# Altium project Main_Board.PrjPcb (part 8 of 44)

## Sheet LTC6952.SchDoc
size A3
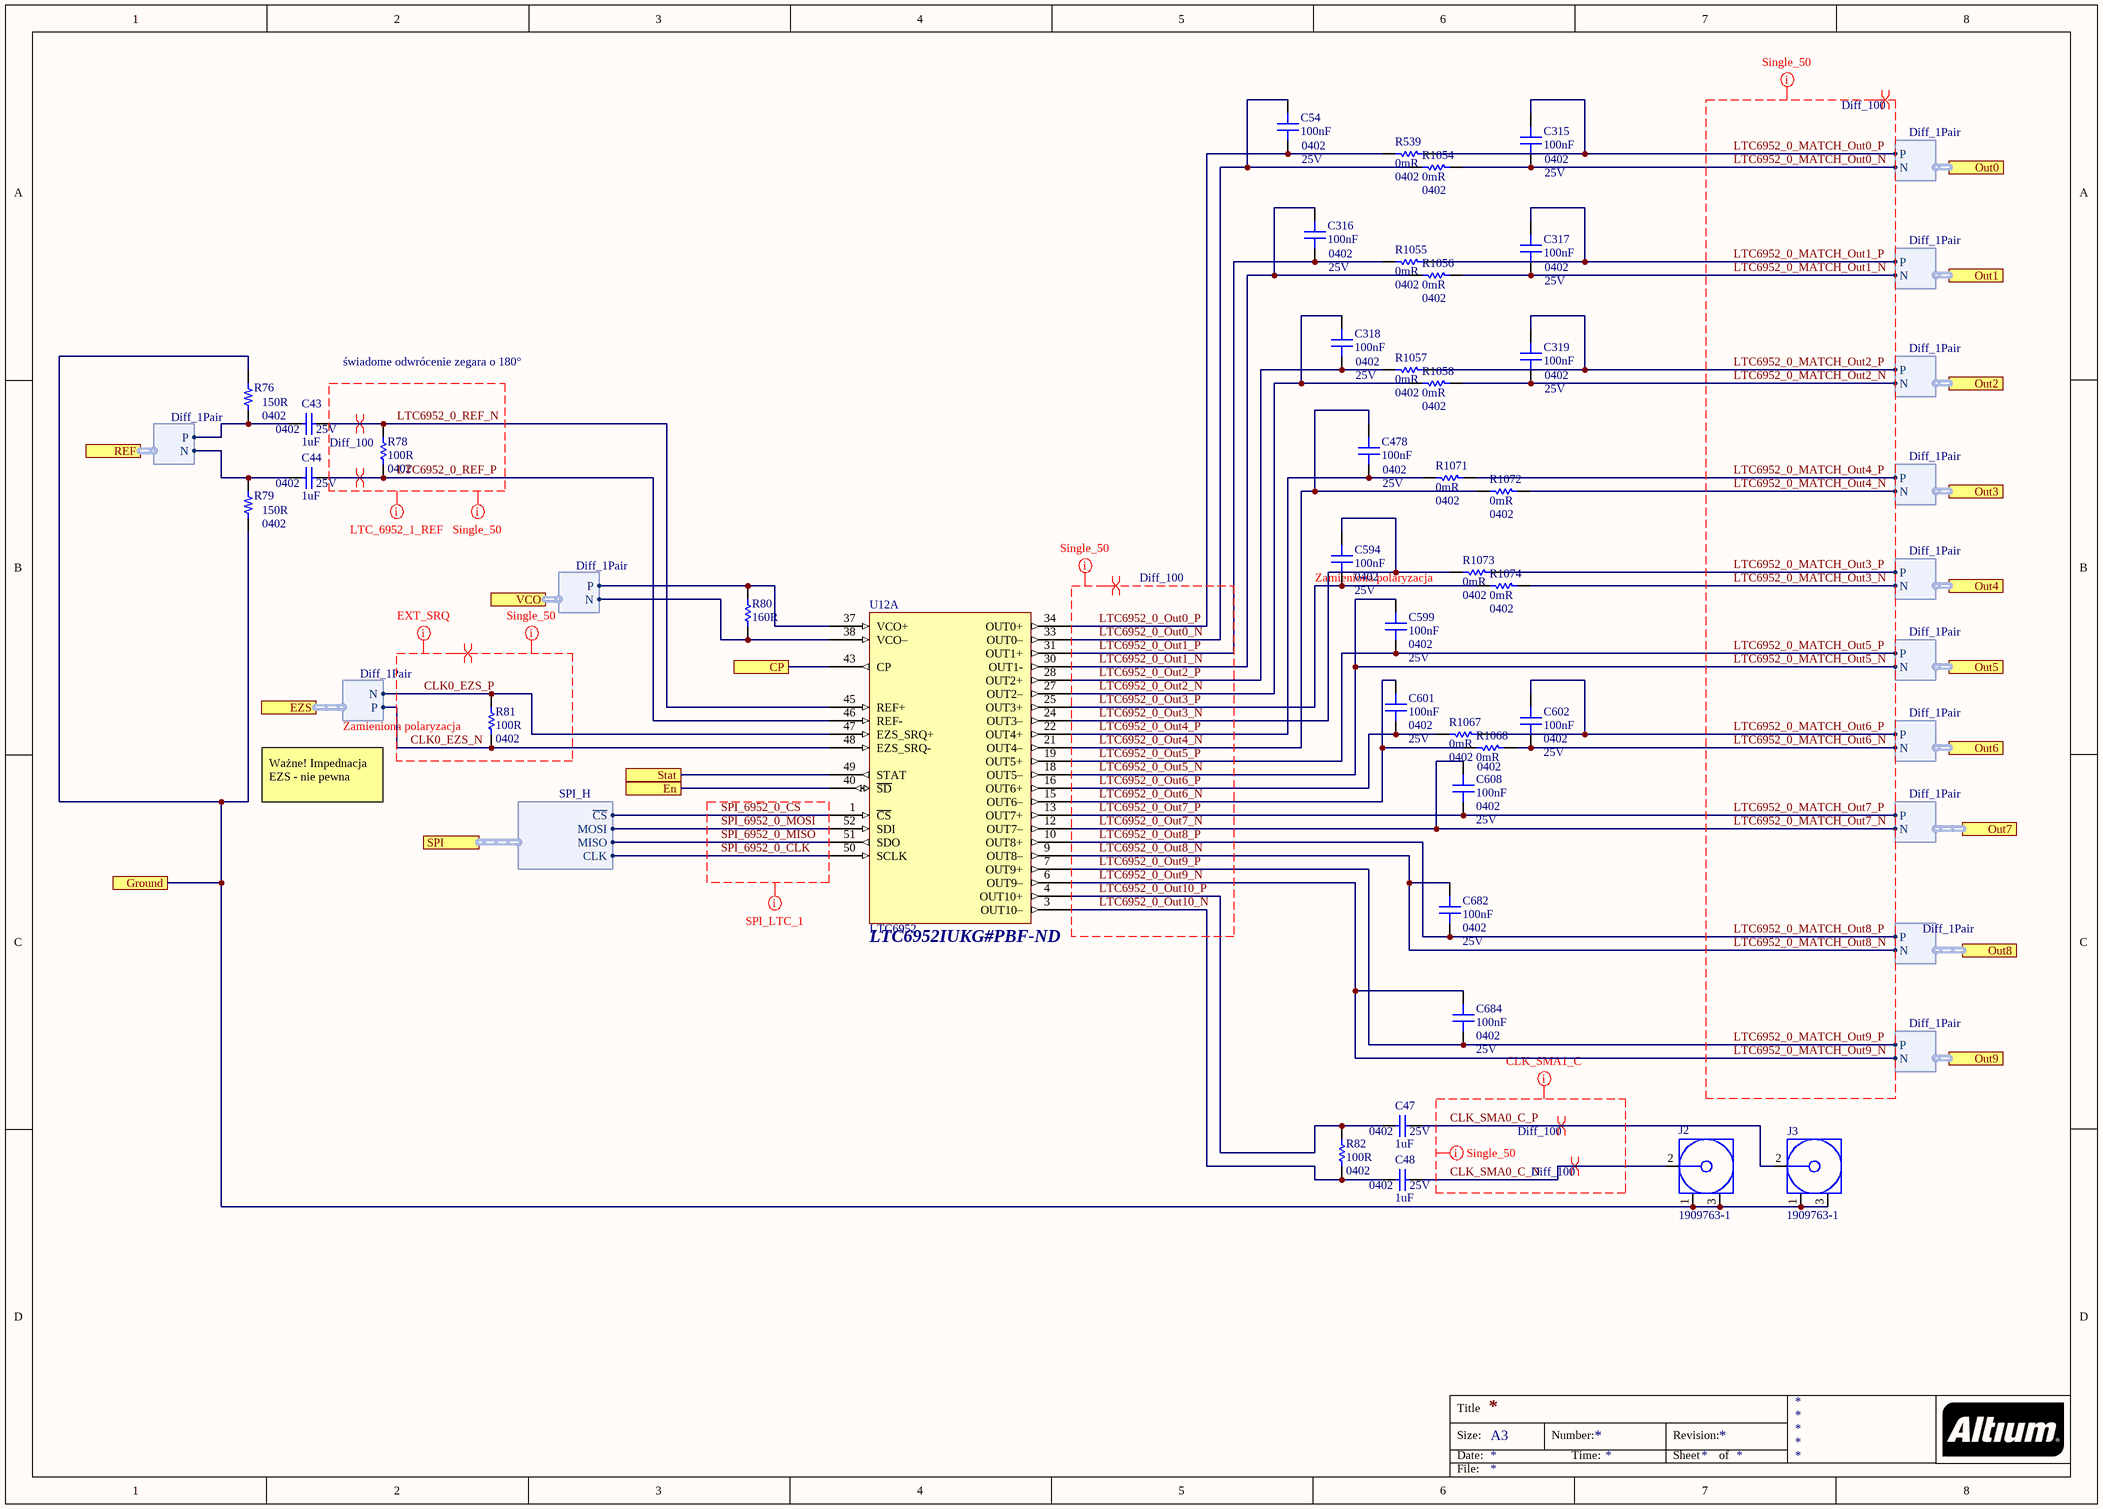
[diagram p9: LTC6952.SchDoc]

### Parts
(Parts that share a designator on the sheet are numbered #1, #2 ... from top to bottom, then left to right.)
C43  1uF  Case/Package: 0402  Voltage Rating: 25V  [CAP 0402/1005 KK]
C44  1uF  Case/Package: 0402  Voltage Rating: 25V  [CAP 0402/1005 KK]
C47  1uF  Case/Package: 0402  Voltage Rating: 25V  [CAP 0402/1005 KK]
C48  1uF  Case/Package: 0402  Voltage Rating: 25V  [CAP 0402/1005 KK]
C54  100nF  Case/Package: 0402  Voltage Rating: 25V  [CAP 0402/1005 KK]
C315  100nF  Case/Package: 0402  Voltage Rating: 25V  [CAP 0402/1005 KK]
C316  100nF  Case/Package: 0402  Voltage Rating: 25V  [CAP 0402/1005 KK]
C317  100nF  Case/Package: 0402  Voltage Rating: 25V  [CAP 0402/1005 KK]
C318  100nF  Case/Package: 0402  Voltage Rating: 25V  [CAP 0402/1005 KK]
C319  100nF  Case/Package: 0402  Voltage Rating: 25V  [CAP 0402/1005 KK]
C478#1  100nF  Case/Package: 0402  Voltage Rating: 25V  [CAP 0402/1005 KK]
C594  100nF  Case/Package: 0402  Voltage Rating: 25V  [CAP 0402/1005 KK]
C599  100nF  Case/Package: 0402  Voltage Rating: 25V  [CAP 0402/1005 KK]
C601  100nF  Case/Package: 0402  Voltage Rating: 25V  [CAP 0402/1005 KK]
C602  100nF  Case/Package: 0402  Voltage Rating: 25V  [CAP 0402/1005 KK]
C608  100nF  Case/Package: 0402  Voltage Rating: 25V  [CAP 0402/1005 KK]
C682  100nF  Case/Package: 0402  Voltage Rating: 25V  [CAP 0402/1005 KK]
C684  100nF  Case/Package: 0402  Voltage Rating: 25V  [CAP 0402/1005 KK]
J2  1909763-1  [TECO-1909763-1_V]
J3  1909763-1  [TECO-1909763-1_V]
R76  150R  Case/Package: 0402  [RES 0402/1005 RF KK]
R78  100R  Case/Package: 0402  [RES 0402/1005 RF KK]
R79  150R  Case/Package: 0402  [RES 0402/1005 RF KK]
R80  160R  [RES 0402/1005 RF KK]
R81  100R  Case/Package: 0402  [RES 0402/1005 RF KK]
R82  100R  Case/Package: 0402  [RES 0402/1005 RF KK]
R539  0mR  Case/Package: 0402  [RES 0402/1005 RF KK]
R1054  0mR  Case/Package: 0402  [RES 0402/1005 RF KK]
R1055  0mR  Case/Package: 0402  [RES 0402/1005 RF KK]
R1056  0mR  Case/Package: 0402  [RES 0402/1005 RF KK]
R1057  0mR  Case/Package: 0402  [RES 0402/1005 RF KK]
R1058  0mR  Case/Package: 0402  [RES 0402/1005 RF KK]
R1067  0mR  Case/Package: 0402  [RES 0402/1005 RF KK]
R1068  0mR  Case/Package: 0402  [RES 0402/1005 RF KK]
R1071  0mR  Case/Package: 0402  [RES 0402/1005 RF KK]
R1072  0mR  Case/Package: 0402  [RES 0402/1005 RF KK]
R1073  0mR  Case/Package: 0402  [RES 0402/1005 RF KK]
R1074  0mR  Case/Package: 0402  [RES 0402/1005 RF KK]
U12  LTC6952  Supplier Part Number 1: LTC6952IUKG#PBF-ND  [LTC6952]  (part A of 2)

### Ports
CP, En, EZS (harness Diff_1Pair), Ground, Out0 (harness Diff_1Pair), Out1 (harness Diff_1Pair), Out2 (harness Diff_1Pair), Out3 (harness Diff_1Pair), Out4 (harness Diff_1Pair), Out5 (harness Diff_1Pair), Out6 (harness Diff_1Pair), Out7 (harness Diff_1Pair), Out8 (harness Diff_1Pair), Out9 (harness Diff_1Pair), REF (harness Diff_1Pair), SPI (harness SPI_H), Stat, VCO (harness Diff_1Pair)

### Harnesses
SPI_H: CLK, MISO, MOSI, ~{CS}
Diff_1Pair: N, P

### Nets
AGND: J2.1 J2.3 J3.1 J3.3 R76.2 R79.1 ; port Ground
CLK0_EZS_N: R81.1 U12.48(EZS_SRQ-) ; port EZS.P
CLK0_EZS_P: R81.2 U12.47(EZS_SRQ+) ; port EZS.N
CLK_SMA0_C_N: C48.1 J2.2
CLK_SMA0_C_P: C47.1 J3.2
Enable_CLK: U12.40(~{SD}) ; port En
LTC6952_0_MATCH_Out0_N: C315.1 R1054.1 ; port Out0.N
LTC6952_0_MATCH_Out0_P: C315.2 R539.1 ; port Out0.P
LTC6952_0_MATCH_Out1_N: C317.1 R1056.1 ; port Out1.N
LTC6952_0_MATCH_Out1_P: C317.2 R1055.1 ; port Out1.P
LTC6952_0_MATCH_Out2_N: C319.1 R1058.1 ; port Out2.N
LTC6952_0_MATCH_Out2_P: C319.2 R1057.1 ; port Out2.P
LTC6952_0_MATCH_Out3_N: R1074.1 ; port Out4.N
LTC6952_0_MATCH_Out3_P: R1073.1 ; port Out4.P
LTC6952_0_MATCH_Out4_N: R1072.2 ; port Out3.N
LTC6952_0_MATCH_Out4_P: R1071.2 ; port Out3.P
LTC6952_0_MATCH_Out5_N: C599.1 U12.18(OUT5–) ; port Out5.N  [also labelled LTC6952_0_Out5_N]
LTC6952_0_MATCH_Out5_P: C599.2 U12.19(OUT5+) ; port Out5.P  [also labelled LTC6952_0_Out5_P]
LTC6952_0_MATCH_Out6_N: C602.2 R1068.1 ; port Out6.N
LTC6952_0_MATCH_Out6_P: C602.1 R1067.1 ; port Out6.P
LTC6952_0_MATCH_Out7_N: C608.1 U12.12(OUT7–) ; port Out7.N  [also labelled LTC6952_0_Out7_N]
LTC6952_0_MATCH_Out7_P: C608.2 U12.13(OUT7+) ; port Out7.P  [also labelled LTC6952_0_Out7_P]
LTC6952_0_MATCH_Out8_N: C682.1 U12.9(OUT8–) ; port Out8.N  [also labelled LTC6952_0_Out8_N]
LTC6952_0_MATCH_Out8_P: C682.2 U12.10(OUT8+) ; port Out8.P  [also labelled LTC6952_0_Out8_P]
LTC6952_0_MATCH_Out9_N: C684.1 U12.6(OUT9–) ; port Out9.N  [also labelled LTC6952_0_Out9_N]
LTC6952_0_MATCH_Out9_P: C684.2 U12.7(OUT9+) ; port Out9.P  [also labelled LTC6952_0_Out9_P]
LTC6952_0_Out0_N: C54.2 R1054.2 U12.33(OUT0–)
LTC6952_0_Out0_P: C54.1 R539.2 U12.34(OUT0+)
LTC6952_0_Out1_N: C316.2 R1056.2 U12.30(OUT1-)
LTC6952_0_Out1_P: C316.1 R1055.2 U12.31(OUT1+)
LTC6952_0_Out2_N: C318.2 R1058.2 U12.27(OUT2–)
LTC6952_0_Out2_P: C318.1 R1057.2 U12.28(OUT2+)
LTC6952_0_Out3_N: C594.1 R1073.2 U12.24(OUT3–)
LTC6952_0_Out3_P: C594.2 R1074.2 U12.25(OUT3+)
LTC6952_0_Out4_N: C478#1.2 R1072.1 U12.21(OUT4–)
LTC6952_0_Out4_P: C478#1.1 R1071.1 U12.22(OUT4+)
LTC6952_0_Out6_N: C601.1 R1068.2 U12.15(OUT6–)
LTC6952_0_Out6_P: C601.2 R1067.2 U12.16(OUT6+)
LTC6952_0_Out10_N: C48.2 R82.1 U12.3(OUT10–)
LTC6952_0_Out10_P: C47.2 R82.2 U12.4(OUT10+)
LTC6952_0_REF_N: C43.1 R78.2 U12.45(REF+)
LTC6952_0_REF_P: C44.1 R78.1 U12.46(REF-)
LTC6952_1_CP_Out: U12.43(CP) ; port CP
LTC6952_1_Temp: U12.49(STAT) ; port Stat
LTC6952_1_VCO_N: R80.2 U12.37(VCO+) ; port VCO.P
LTC6952_1_VCO_P: R80.1 U12.38(VCO–) ; port VCO.N
Si53323_2_Q1_N: C44.2 R79.2 ; port REF.N
Si53323_2_Q1_P: C43.2 R76.1 ; port REF.P
SPI_6952_0_CLK: U12.50(SCLK) ; port SPI.CLK  [project net CLK0_SPI.CLK]
SPI_6952_0_CS: U12.1(~{CS}) ; port SPI.~{CS}  [project net CLK0_SPI.~{CS}]
SPI_6952_0_MISO: U12.51(SDO) ; port SPI.MISO  [project net CLK0_SPI.MISO]
SPI_6952_0_MOSI: U12.52(SDI) ; port SPI.MOSI  [project net CLK0_SPI.MOSI]

### Layout directives
differential pair; differential pair class Diff_100: CLK0_EZS_N, CLK0_EZS_P, CLK_SMA0_C_N, CLK_SMA0_C_P, LTC6952_0_MATCH_Out0_N, LTC6952_0_MATCH_Out0_P, LTC6952_0_MATCH_Out1_N, LTC6952_0_MATCH_Out1_P, LTC6952_0_MATCH_Out2_N, LTC6952_0_MATCH_Out2_P, LTC6952_0_MATCH_Out3_N, LTC6952_0_MATCH_Out3_P, LTC6952_0_MATCH_Out4_N, LTC6952_0_MATCH_Out4_P, LTC6952_0_MATCH_Out5_N, LTC6952_0_MATCH_Out5_P, LTC6952_0_MATCH_Out6_N, LTC6952_0_MATCH_Out6_P, LTC6952_0_MATCH_Out7_N, LTC6952_0_MATCH_Out7_P, LTC6952_0_MATCH_Out8_N, LTC6952_0_MATCH_Out8_P, LTC6952_0_MATCH_Out9_N, LTC6952_0_MATCH_Out9_P, LTC6952_0_Out0_N, LTC6952_0_Out0_P, LTC6952_0_Out1_N, LTC6952_0_Out1_P, LTC6952_0_Out2_N, LTC6952_0_Out2_P, LTC6952_0_Out3_N, LTC6952_0_Out3_P, LTC6952_0_Out4_N, LTC6952_0_Out4_P, LTC6952_0_Out5_N, LTC6952_0_Out5_P, LTC6952_0_Out6_N, LTC6952_0_Out6_P, LTC6952_0_Out7_N, LTC6952_0_Out7_P, LTC6952_0_Out8_N, LTC6952_0_Out8_P, LTC6952_0_Out9_N, LTC6952_0_Out9_P, LTC6952_0_Out10_N, LTC6952_0_Out10_P, LTC6952_0_REF_N, LTC6952_0_REF_P
net class Single_50: CLK0_EZS_N, CLK0_EZS_P, CLK_SMA0_C_N, CLK_SMA0_C_P, LTC6952_0_MATCH_Out0_N, LTC6952_0_MATCH_Out0_P, LTC6952_0_MATCH_Out1_N, LTC6952_0_MATCH_Out1_P, LTC6952_0_MATCH_Out2_N, LTC6952_0_MATCH_Out2_P, LTC6952_0_MATCH_Out3_N, LTC6952_0_MATCH_Out3_P, LTC6952_0_MATCH_Out4_N, LTC6952_0_MATCH_Out4_P, LTC6952_0_MATCH_Out5_N, LTC6952_0_MATCH_Out5_P, LTC6952_0_MATCH_Out6_N, LTC6952_0_MATCH_Out6_P, LTC6952_0_MATCH_Out7_N, LTC6952_0_MATCH_Out7_P, LTC6952_0_MATCH_Out8_N, LTC6952_0_MATCH_Out8_P, LTC6952_0_MATCH_Out9_N, LTC6952_0_MATCH_Out9_P, LTC6952_0_Out0_N, LTC6952_0_Out0_P, LTC6952_0_Out1_N, LTC6952_0_Out1_P, LTC6952_0_Out2_N, LTC6952_0_Out2_P, LTC6952_0_Out3_N, LTC6952_0_Out3_P, LTC6952_0_Out4_N, LTC6952_0_Out4_P, LTC6952_0_Out5_N, LTC6952_0_Out5_P, LTC6952_0_Out6_N, LTC6952_0_Out6_P, LTC6952_0_Out7_N, LTC6952_0_Out7_P, LTC6952_0_Out8_N, LTC6952_0_Out8_P, LTC6952_0_Out9_N, LTC6952_0_Out9_P, LTC6952_0_Out10_N, LTC6952_0_Out10_P, LTC6952_0_REF_N, LTC6952_0_REF_P
net class CLK_SMA1_C: CLK_SMA0_C_N, CLK_SMA0_C_P
net class LTC_6952_1_REF: LTC6952_0_REF_N, LTC6952_0_REF_P
net class EXT_SRQ: CLK0_EZS_N, CLK0_EZS_P
net class SPI_LTC_1: SPI_6952_0_CLK, SPI_6952_0_CS, SPI_6952_0_MISO, SPI_6952_0_MOSI

### Notes on the sheet
- świadome odwrócenie zegara o 180°
- (near C594) Zamieniona polaryzacja
- (near R81) Zamieniona polaryzacja
- Ważne! Impednacja EZS - nie pewna
- Title
- Size:
- Date:
- A3
- Number:
- Time:
- Revision:
- Sheet
- of
- File:

### Library data of the parts
C43 C44 C47 C48 = Capacitor: MURATA - GRT155R61E105KE01D - SMD Multilayer Ceramic Capacitor, 1 µF, 25 V, 0402 [1005 Metric], ± 10%, X5R, GRT Series - SMD Multilayer Ceramic Capacitor, 1 µF, 25 V, 0402 [1005 Metric], ± 10%, X5R, GRT Series; Supplier 1: Digi-Key; Supplier Part Number 1: 490-12263-1-ND; Manufacturer: Murata; Manufacturer Part Number: GRT155R61E105KE01D; RoHS: Yes; Category: Ceramic Capacitors; Stock 1: 341453; Pricing 1: 1=0,18000, 10=0,12300, 100=0,06210, 500=0,04248, 1000=0,03758, 2500=0,03594, 5000=0,03268 (USD); Mount: Surface Mount; Case Code (Metric): 1005; Case Code (Imperial): 0402; Min Operating Temperature: -55°C; Max Operating Temperature: 85°C; Packaging: Tape and Reel; Capacitance: 1uF; Tolerance: 10%; Dielectric: X5R; Voltage Rating (DC): 25V; Length: 0.039inch; Width: 0.02inch; Thickness: 0.022inch; Ratings: AEC-Q200; ComponentLink1URL: http://www.farnell.com/datasheets/2165918.pdf?src-supplier=Farnell; ComponentLink1Description: http://www.farnell.com/datasheets/2165918.pdf?src-supplier=Farnell; ComponentLink2URL: http://search.murata.co.jp/Ceramy/image/img/A01X/G101/ENG/GRT155R61E105KE01-01.pdf?src-supplier=Digi-Key; ComponentLink2Description: http://search.murata.co.jp/Ceramy/image/img/A01X/G101/ENG/GRT155R61E105KE01-01.pdf?src-supplier=Digi-Key; ComponentLink3URL: http://www.farnell.com/datasheets/2165918.pdf?src-supplier=Element14; ComponentLink3Description: http://www.farnell.com/datasheets/2165918.pdf?src-supplier=Element14
C54 C315-C319 C478#1 C594 C599 C601 C602 C608 C682 C684 = Capacitor: Manufacturer: Murata; Manufacturer Part Number: GRM155R71E104KE14J; Tolerance: 10%; Dielectric: X7R; Supplier 1: Digi-Key; Supplier Part Number 1: 490-14603-1-ND; Stock 1: 89275; Pricing 1: 1 = 0,10000, 10 = 0,03400, 100 = 0,01520, 500 = 0,01088, 1000 = 0,00855, 2500 = 0,00778, 5000 = 0,00715 (USD); RoHS: Yes; Mount: Surface Mount; Weight: 0.000212oz; Case Code (Imperial): 0402; Case Code (Metric): 1005; Min Operating Temperature: -55°C; Max Operating Temperature: 125°C; Packaging: Tape and Reel; Capacitance: 100nF; Termination: SMD/SMT; Composition: Ceramic; Voltage Rating (DC): 25V; Package Quantity: 50000; Length: 0.039inch; Height: 0.5mm; Width: 0.5mm; Thickness: 0.022inch; ComponentLink1URL: http://www.mouser.com/ds/2/281/c02e-2905.pdf?src-supplier=Mouser; ComponentLink1Description: http://www.mouser.com/ds/2/281/c02e-2905.pdf?src-supplier=Mouser; ComponentLink2URL: http://search.murata.co.jp/Ceramy/image/img/A01X/G101/ENG/GRM155R71E104KE14-01.pdf?src-supplier=Digi-Key; ComponentLink2Description: http://search.murata.co.jp/Ceramy/image/img/A01X/G101/ENG/GRM155R71E104KE14-01.pdf?src-supplier=Digi-Key
J2 J3 = 1909763-1: Ultra Miniature Coaxial Connector Jack, 60 V, 50 Ohm, -40 to 90 degC, RoHS, Tape and Reel; Brand: TE Connectivity / AMP; Maximum Frequency: 6 GHz; Gender: Jack (Female); Body Material: Liquid Crystal Polymer (LCP); RF Series: UMCC; Impedance: 50 Ohms; DatasheetVersion: Rev. B2; PackageReference: SMD; PackageDescription: 3-Pin Surface Mount Device, Body 2.6 x 2.6 mm; Supplier 1: Newark; Supplier Part Number 1: 62X0488; Supplier 2: Farnell; Supplier Part Number 2: 2781689; Supplier 3: Digi-Key; Supplier Part Number 3: A118077TR-ND; Supplier 4: Digi-Key; Supplier Part Number 4: A118077CT-ND; Supplier 5: Digi-Key; Supplier Part Number 5: A118077DKR-ND; Product Category: RF Connectors / Coaxial Connectors; Packaging: Reel; Product: Connectors; Orientation: Straight; Operating Temperature Range: - 40 C to + 90 C; Factory Pack Quantity: 5000; RoHS: Details; Contact Plating: Gold; Contact Material: Copper Alloy; Mounting Technology: Surface Mount; ComponentLink1Description: Manufacturer URL; ComponentLink1URL: http://www.te.com; ComponentLink2Description: Datasheet; ComponentLink2URL: http://www.te.com/commerce/DocumentDelivery/DDEController?Action=srchrtrv&DocNm=1909763&DocType=Customer+Drawing&DocLang=English
R76 R79 = Resistor: RES SMD 150 OHM 1% 1/10W 0402; Manufacturer: Panasonic; Manufacturer Part Number: ERJ-2RKF1500X; Temperature Coefficient: 100ppm/°C; Power Rating: 100mW; Voltage Rating: 50V; Supplier 1: Digi-Key; Supplier Part Number 1: P150LCT-ND; RoHS: Yes; Category: Chip SMD Resistors; Stock 1: 1074892; Pricing 1: 1=0,10000, 10=0,04100, 100=0,01670, 1000=0,00751, 2500=0,00652, 5000=0,00538 (USD); Mount: Surface Mount; Number of Pins: 2; Contact Plating: Tin; Case Code (Metric): 1005; Case Code (Imperial): 0402; Min Operating Temperature: -55°C; Max Operating Temperature: 155°C; Resistance: 150R; Tolerance: 1%; Composition: Thick Film; Packaging: Tape and Reel; Package Quantity: 1; Number of Terminations: 2; Termination: SMD/SMT; Military Standard: Not; Max Power Dissipation: 100mW; Voltage Rating (DC): 50V; Features: Automotive AEC-Q200; Length: 1mm; Height: 0.35mm; Width: 0.02inch; Depth: 0.5mm; Radiation Hardening: No; REACH SVHC: No SVHC; Lead Free: Lead Free; ComponentLink1URL: https://datasheet.ciiva.com/34303/1987126-34303555.pdf?src-supplier=Jameco; ComponentLink1Description: https://datasheet.ciiva.com/34303/1987126-34303555.pdf?src-supplier=Jameco; ComponentLink2URL: https://datasheet.ciiva.com/11821/0900766b80f80784-11821183.pdf?src-supplier=RSComponents; ComponentLink2Description: https://datasheet.ciiva.com/11821/0900766b80f80784-11821183.pdf?src-supplier=RSComponents; ComponentLink3URL: https://datasheet.ciiva.com/16774/70260748-16774549.pdf?src-supplier=Allied+Electronics; ComponentLink3Description: https://datasheet.ciiva.com/16774/70260748-16774549.pdf?src-supplier=Allied+Electronics; ComponentLink4URL: https://datasheet.ciiva.com/43467/1678782-43467237.pdf?src-supplier=Farnell; ComponentLink4Description: https://datasheet.ciiva.com/43467/1678782-43467237.pdf?src-supplier=Farnell; ComponentLink5URL: https://datasheet.ciiva.com/7887/426256-7887016.pdf?src-supplier=Element14; ComponentLink5Description: https://datasheet.ciiva.com/7887/426256-7887016.pdf?src-supplier=Element14; ComponentLink6URL: https://datasheet.ciiva.com/16371/aoa0000ce2-16371497.pdf?src-supplier=Future+Electronics; ComponentLink6Description: https://datasheet.ciiva.com/16371/aoa0000ce2-16371497.pdf?src-supplier=Future+Electronics; ComponentLink7URL: https://datasheet.ciiva.com/7886/aoa0000ce2-7886714.pdf?src-supplier=Element14; ComponentLink7Description: https://datasheet.ciiva.com/7886/aoa0000ce2-7886714.pdf?src-supplier=Element14; ComponentLink8URL: https://datasheet.ciiva.com/46373/1678782-46373162.pdf?src-supplier=Element14; ComponentLink8Description: https://datasheet.ciiva.com/46373/1678782-46373162.pdf?src-supplier=Element14; ComponentLink9URL: https://datasheet.ciiva.com/46373/1678782-46373163.pdf?src-supplier=Element14; ComponentLink9Description: https://datasheet.ciiva.com/46373/1678782-46373163.pdf?src-supplier=Element14; ComponentLink10URL: https://datasheet.ciiva.com/16770/70260748-16770572.pdf?src-supplier=Allied+Electronics; ComponentLink10Description: https://datasheet.ciiva.com/16770/70260748-16770572.pdf?src-supplier=Allied+Electronics; ComponentLink11URL: https://datasheet.ciiva.com/17207/aoa0000ce2-17207389.pdf?src-supplier=Avnet+Europe; ComponentLink11Description: https://datasheet.ciiva.com/17207/aoa0000ce2-17207389.pdf?src-supplier=Avnet+Europe; ComponentLink12URL: https://datasheet.ciiva.com/28568/1678782-28568846.pdf?src-supplier=Element14; ComponentLink12Description: https://datasheet.ciiva.com/28568/1678782-28568846.pdf?src-supplier=Element14; ComponentLink13URL: https://datasheet.ciiva.com/30106/aoa0000ce2-30106926.pdf?src-supplier=Onlinecomponents.com; ComponentLink13Description: https://datasheet.ciiva.com/30106/aoa0000ce2-30106926.pdf?src-supplier=Onlinecomponents.com; ComponentLink14URL: https://datasheet.ciiva.com/22673/1678782-22673679.pdf?src-supplier=Element14; ComponentLink14Description: https://datasheet.ciiva.com/22673/1678782-22673679.pdf?src-supplier=Element14
R78 R81 R82 = Resistor: RES SMD 100 OHM 1% 1/16W 0402; Manufacturer: Yageo; Manufacturer Part Number: RC0402FR-07100RL; Power Rating: 62.5mW; Voltage Rating: 50V; Temperature Coefficient: 100ppm/°C; Supplier 1: Digi-Key; Supplier Part Number 1: 311-100LRDKR-ND; RoHS: Yes; Category: Chip SMD Resistors; Stock 1: 42078262; Pricing 1: 1=0,10000, 10=0,01600, 100=0,00640, 1000=0,00289, 2500=0,00251, 5000=0,00207 (USD); Number of Pins: 2; Case Code (Imperial): 0402; Case Code (Metric): 1005; Min Operating Temperature: -55°C; Max Operating Temperature: 155°C; Tolerance: 1%; Resistance: 100R; Packaging: Tape and Reel; Termination: SMD/SMT; Composition: Thick Film; Military Standard: Not; Voltage Rating (DC): 50V; Length: 1mm; Height: 0.32mm; Depth: 0.5mm; Width: 0.5mm; REACH SVHC: No SVHC; Lead Free: Lead Free; ComponentLink1URL: https://datasheet.ciiva.com/7849/1784430-7849810.pdf?src-supplier=Element14; ComponentLink1Description: https://datasheet.ciiva.com/7849/1784430-7849810.pdf?src-supplier=Element14; ComponentLink2URL: https://datasheet.ciiva.com/11808/0900766b80c66297-11808765.pdf?src-supplier=RSComponents; ComponentLink2Description: https://datasheet.ciiva.com/11808/0900766b80c66297-11808765.pdf?src-supplier=RSComponents; ComponentLink3URL: https://datasheet.ciiva.com/12667/pyu-rc0402-51-rohs-l-6-r-12667957.pdf?src-supplier=Mouser; ComponentLink3Description: https://datasheet.ciiva.com/12667/pyu-rc0402-51-rohs-l-6-r-12667957.pdf?src-supplier=Mouser; ComponentLink4URL: https://datasheet.ciiva.com/16740/pyu-rc0402-51-rohs-l-6-r-16740566.pdf?src-supplier=Future+Electronics; ComponentLink4Description: https://datasheet.ciiva.com/16740/pyu-rc0402-51-rohs-l-6-r-16740566.pdf?src-supplier=Future+Electronics; ComponentLink5URL: https://datasheet.ciiva.com/15189/getdatasheetpartid-329466-15189335.pdf?src-supplier=Verical; ComponentLink5Description: https://datasheet.ciiva.com/15189/getdatasheetpartid-329466-15189335.pdf?src-supplier=Verical; ComponentLink6URL: https://datasheet.ciiva.com/28367/1018594-28367226.pdf?src-supplier=Element14; ComponentLink6Description: https://datasheet.ciiva.com/28367/1018594-28367226.pdf?src-supplier=Element14; ComponentLink7URL: https://datasheet.ciiva.com/22747/1018594-22747511.pdf?src-supplier=Element14; ComponentLink7Description: https://datasheet.ciiva.com/22747/1018594-22747511.pdf?src-supplier=Element14
R80 = Resistor: Res Thick Film 0402 160 Ohm 1% 1/16W 100ppm/C Molded SMD SMD Paper T/R; Manufacturer: Stackpole Electronics; Manufacturer Part Number: RMCF0402FT160R; Temperature Coefficient: 100ppm/°C; Supplier 1: Digi-Key; Supplier Part Number 1: RMCF0402FT160RCT-ND; RoHS: Yes; Category: Chip SMD Resistors; Stock 1: 34661; Pricing 1: 1=0,10000, 10=0,01400, 100=0,00580, 1000=0,00262, 2500=0,00228, 5000=0,00188 (USD); Mount: Surface Mount; Case/Package: 0402; Contact Plating: Tin,Matte; Min Operating Temperature: -55°C; Max Operating Temperature: 155°C; Packaging: Tape and Reel; Resistance: 160R; Tolerance: 1%; Composition: Thick Film; Radiation Hardening: No; ComponentLink1URL: https://www.seielect.com/catalog/SEI-RMCF_RMCP.pdf?src-supplier=Avnet; ComponentLink1Description: https://www.seielect.com/catalog/SEI-RMCF_RMCP.pdf?src-supplier=Avnet
R539 R1054-R1058 R1067 R1068 R1071-R1074 = Resistor: Manufacturer 1: Yageo; Manufacturer Part Number 1: RC0402JR-070RL; Power Rating: 62.5mW; Tolerance: 5%; Voltage Rating: 50V; Max Power Dissipation: 63mW; Temperature Coefficient: 200ppm/°C; Supplier 1: Digi-Key; Supplier Part Number 1: 311-0.0JRCT-ND; Stock 1: 69822252; Pricing 1: 1=0.10000, 10=0.01200, 25=0.00920, 50=0.00680, 100=0.00510, 250=0.00388, 500=0.00308, 1000=0.00227, 5000=0.00163 (USD); RoHS: Yes; Contact Plating: Tin,Matte; Case Code (Metric): 1005; Case Code (Imperial): 0402; Min Operating Temperature: -55°C; Max Operating Temperature: 155°C; Resistance: 0mR; Packaging: Tape and Reel; Composition: Thick Film; Package Quantity: 1; Number of Terminations: 2; Termination: SMD/SMT; Military Standard: Not; Features: Moisture Resistant; Length: 1mm; Height: 0.016inch; Width: 0.02inch; Depth: 0.5mm; Radiation Hardening: No; REACH SVHC: Unknown; Lead Free: Lead Free; ComponentLink1URL: https://datasheet.ciiva.com/2452/pyu-rc0402-51-rohs-l-6-2452608.pdf?src-supplier=Digi-Key; ComponentLink1Description: https://datasheet.ciiva.com/2452/pyu-rc0402-51-rohs-l-6-2452608.pdf?src-supplier=Digi-Key; ComponentLink2URL: https://datasheet.ciiva.com/11808/0900766b80c66297-11808195.pdf?src-supplier=RSComponents; ComponentLink2Description: https://datasheet.ciiva.com/11808/0900766b80c66297-11808195.pdf?src-supplier=RSComponents; ComponentLink3URL: https://datasheet.ciiva.com/2452/pyu-r-int-thick-7-2452609.pdf?src-supplier=Digi-Key; ComponentLink3Description: https://datasheet.ciiva.com/2452/pyu-r-int-thick-7-2452609.pdf?src-supplier=Digi-Key; ComponentLink4URL: https://datasheet.ciiva.com/22747/1018594-22747515.pdf?src-supplier=Element14; ComponentLink4Description: https://datasheet.ciiva.com/22747/1018594-22747515.pdf?src-supplier=Element14; ComponentLink5URL: https://datasheet.ciiva.com/7983/1018594-7983535.pdf?src-supplier=Element14; ComponentLink5Description: https://datasheet.ciiva.com/7983/1018594-7983535.pdf?src-supplier=Element14; ComponentLink6URL: https://datasheet.ciiva.com/2452/pyu-r-int-thick-7-2452610.pdf?src-supplier=Digi-Key; ComponentLink6Description: https://datasheet.ciiva.com/2452/pyu-r-int-thick-7-2452610.pdf?src-supplier=Digi-Key; ComponentLink7URL: https://datasheet.ciiva.com/8896/pyu-rc0402-51-rohs-l-6-8896201.pdf?src-supplier=Avnet; ComponentLink7Description: https://datasheet.ciiva.com/8896/pyu-rc0402-51-rohs-l-6-8896201.pdf?src-supplier=Avnet; ComponentLink8URL: https://datasheet.ciiva.com/28386/pyu-rc0402-51-rohs-l-6-28386633.pdf?src-supplier=Avnet+Europe; ComponentLink8Description: https://datasheet.ciiva.com/28386/pyu-rc0402-51-rohs-l-6-28386633.pdf?src-supplier=Avnet+Europe; ComponentLink9URL: https://datasheet.ciiva.com/15189/getdatasheetpartid-326379-15189533.pdf?src-supplier=Verical; ComponentLink9Description: https://datasheet.ciiva.com/15189/getdatasheetpartid-326379-15189533.pdf?src-supplier=Verical
U12 = LTC6952: Dystrybutor Zegarów; Manufacturer: Analog Devices; Manufacturer Part Number: LTC6952IUKG#PBF; Supplier 1: Digi-Key; Stock 1: 267; Pricing 1: 1 = 30,78000, 25 = 24,62680, 100 = 21,36000, 250 = 20,50564, 500 = 19,86492 (USD); RoHS: No; Number of Pins: 52

## Sheet Ultrascale+_02.SchDoc: Ultrascale+_02
size A3; Organization: Altium Limited; Address1: L3, 12a Rodborough Rd; Address2: Frenchs Forest; Address3: NSW; Address4: Australia 2086
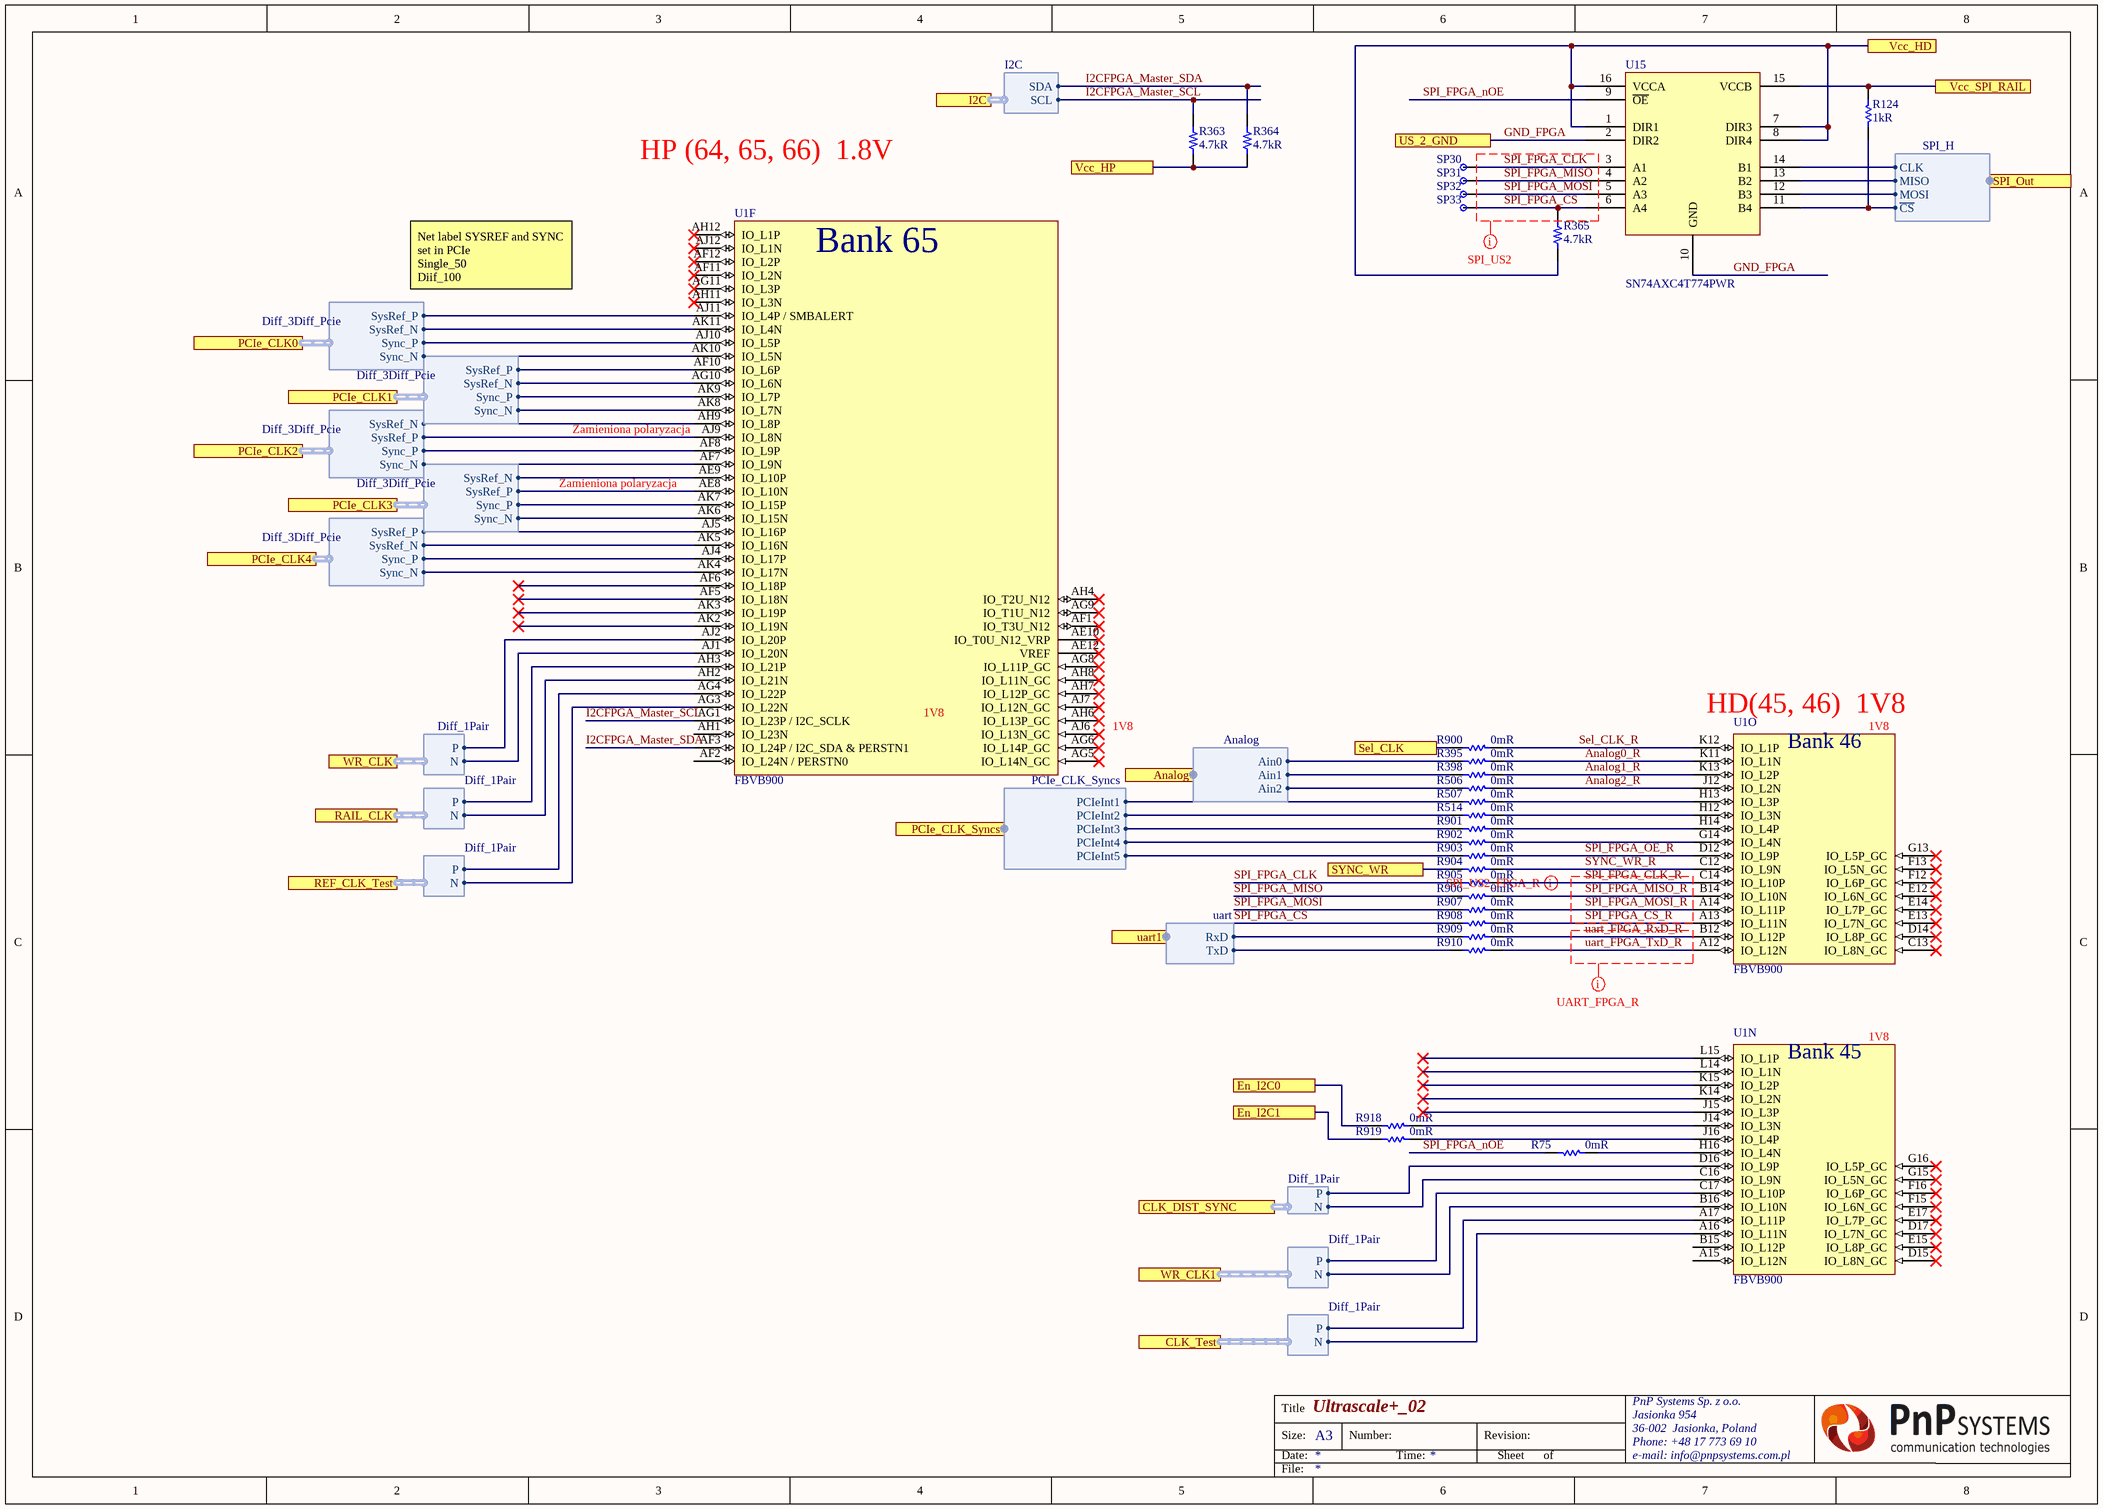
[diagram p10: Ultrascale+_02.SchDoc]

### Parts
R75  0mR  [RES 0402/1005 RF KK]
R124  1kR  [RES 0402/1005 RF KK]
R363  4.7kR  [RES 0402/1005 RF KK]
R364  4.7kR  [RES 0402/1005 RF KK]
R365  4.7kR  [RES 0402/1005 RF KK]
R395  0mR  [RES 0402/1005 RF KK]
R398  0mR  [RES 0402/1005 RF KK]
R506  0mR  [RES 0402/1005 RF KK]
R507  0mR  [RES 0402/1005 RF KK]
R514  0mR  [RES 0402/1005 RF KK]
R900  0mR  [RES 0402/1005 RF KK]
R901  0mR  [RES 0402/1005 RF KK]
R902  0mR  [RES 0402/1005 RF KK]
R903  0mR  [RES 0402/1005 RF KK]
R904  0mR  [RES 0402/1005 RF KK]
R905  0mR  [RES 0402/1005 RF KK]
R906  0mR  [RES 0402/1005 RF KK]
R907  0mR  [RES 0402/1005 RF KK]
R908  0mR  [RES 0402/1005 RF KK]
R909  0mR  [RES 0402/1005 RF KK]
R910  0mR  [RES 0402/1005 RF KK]
R918  0mR  [RES 0402/1005 RF KK]
R919  0mR  [RES 0402/1005 RF KK]
SP30  SP  [MeasureTP]  (value not drawn)
SP31  SP  [MeasureTP]  (value not drawn)
SP32  SP  [MeasureTP]  (value not drawn)
SP33  SP  [MeasureTP]  (value not drawn)
U1  FBVB900  [FBVB900 XX]  (parts F,N,O of 23)
U15  SN74AXC4T774PWR  [SN74AXC4T774PWR]

### Ports
Analog (harness Analog), CLK_DIST_SYNC (harness Diff_1Pair), CLK_Test (harness Diff_1Pair), En_I2C0, En_I2C1, I2C (harness I2C), PCIe_CLK0 (harness Diff_3Diff_Pcie), PCIe_CLK1 (harness Diff_3Diff_Pcie), PCIe_CLK2 (harness Diff_3Diff_Pcie), PCIe_CLK3 (harness Diff_3Diff_Pcie), PCIe_CLK4 (harness Diff_3Diff_Pcie), PCIe_CLK_Syncs (harness PCIe_CLK_Syncs), RAIL_CLK (harness Diff_1Pair), REF_CLK_Test (harness Diff_1Pair), Sel_CLK, SPI_Out (harness SPI_H), SYNC_WR, uart1 (harness uart), US_2_GND, Vcc_HD, Vcc_HP, Vcc_SPI_RAIL, WR_CLK1 (harness Diff_1Pair), WR_CLK (harness Diff_1Pair)

### Harnesses
I2C: SDA, SCL
uart: RxD, TxD
Diff_1Pair: N, P
Diff_1Pair: P, N
SPI_H: CLK, MISO, MOSI, ~{CS}
Analog: Ain0, Ain1, Ain2
PCIe_CLK_Syncs: PCIeInt1, PCIeInt2, PCIeInt3, PCIeInt4, PCIeInt5
Diff_3Diff_Pcie: SysRef_N, SysRef_P, Sync_P, Sync_N

### Nets
GND_FPGA: U15.2(DIR2) U15.10(GND) ; port US_2_GND  [project net B503_Ground]
3V3_RAIL: R124.2 U15.15(VCCB) ; port Vcc_SPI_RAIL
Analog0_R: R395.1 U1.K11(IO_L1N)
Analog1_R: R398.1 U1.K13(IO_L2P)
Analog2_R: R506.1 U1.J12(IO_L2N)
CLK0_EZS_N: U1.D16(IO_L9P) ; port CLK_DIST_SYNC.P
CLK0_EZS_P: U1.C16(IO_L9N) ; port CLK_DIST_SYNC.N
D_05028_G0: R904.2 ; port SYNC_WR
I2CFPGA_Master_SCL: R363.2 U1.AG1(IO_L23P_/_I2C_SCLK) ; port I2C.SCL  [project net I2C_LS.SCL]
I2CFPGA_Master_SDA: R364.2 U1.AF3(IO_L24P_/_I2C_SDA_&_PERSTN1) ; port I2C.SDA  [project net I2C_LS.SDA]
LTC6952_1_MATCH_Out1_N: U1.AH2(IO_L21N) ; port RAIL_CLK.N
LTC6952_1_MATCH_Out1_P: U1.AH3(IO_L21P) ; port RAIL_CLK.P
LTC6952_1_Temp: R395.2 ; port Analog.Ain0
LTC6952_2_Temp: R398.2 ; port Analog.Ain1
LTC6952_3_Temp: R506.2 ; port Analog.Ain2
RF_SYSREF_TO_FPGA_N: U1.AK11(IO_L4N) ; port PCIe_CLK0.SysRef_N
RF_SYSREF_TO_FPGA_N: U1.AG10(IO_L6N) ; port PCIe_CLK1.SysRef_N  [a separate net that carries the same name]
RF_SYSREF_TO_FPGA_N: U1.AH9(IO_L8P) ; port PCIe_CLK2.SysRef_N  [a separate net that carries the same name]
RF_SYSREF_TO_FPGA_N: U1.AE9(IO_L10P) ; port PCIe_CLK3.SysRef_N  [a separate net that carries the same name]
RF_SYSREF_TO_FPGA_N: U1.AK5(IO_L16N) ; port PCIe_CLK4.SysRef_N  [a separate net that carries the same name]
RF_SYSREF_TO_FPGA_P: U1.AJ11(IO_L4P_/_SMBALERT) ; port PCIe_CLK0.SysRef_P
RF_SYSREF_TO_FPGA_P: U1.AF10(IO_L6P) ; port PCIe_CLK1.SysRef_P  [a separate net that carries the same name]
RF_SYSREF_TO_FPGA_P: U1.AJ9(IO_L8N) ; port PCIe_CLK2.SysRef_P  [a separate net that carries the same name]
RF_SYSREF_TO_FPGA_P: U1.AE8(IO_L10N) ; port PCIe_CLK3.SysRef_P  [a separate net that carries the same name]
RF_SYSREF_TO_FPGA_P: U1.AJ5(IO_L16P) ; port PCIe_CLK4.SysRef_P  [a separate net that carries the same name]
Sel_CLK_R: R900.1 U1.K12(IO_L1P)
SetClk_Si53323_2: R900.2 ; port Sel_CLK
Si53323_1_Q2_LVDS_N: U1.AG3(IO_L22N) ; port REF_CLK_Test.N
Si53323_1_Q2_LVDS_P: U1.AG4(IO_L22P) ; port REF_CLK_Test.P
Si53323_2_Q2_LVDS_N: U1.A16(IO_L11N) ; port CLK_Test.N
Si53323_2_Q2_LVDS_P: U1.A17(IO_L11P) ; port CLK_Test.P
SPI1_CLK: U15.14(B1) ; port SPI_Out.CLK
SPI1_CS: R124.1 U15.11(B4) ; port SPI_Out.~{CS}
SPI1_MISO: U15.13(B2) ; port SPI_Out.MISO
SPI1_MOSI: U15.12(B3) ; port SPI_Out.MOSI
SPI_FPGA_CLK: R905.2 SP30.1 U15.3(A1)
SPI_FPGA_CLK_R: R905.1 U1.C14(IO_L10P)
SPI_FPGA_CS: R365.2 R908.2 SP33.1 U15.6(A4)
SPI_FPGA_CS_R: R908.1 U1.A13(IO_L11N)
SPI_FPGA_MISO: R906.2 SP31.1 U15.4(A2)
SPI_FPGA_MISO_R: R906.1 U1.B14(IO_L10N)
SPI_FPGA_MOSI: R907.2 SP32.1 U15.5(A3)
SPI_FPGA_MOSI_R: R907.1 U1.A14(IO_L11P)
SPI_FPGA_nOE: R75.2 U15.9(~{OE})
SPI_FPGA_OE_R: R903.1 U1.D12(IO_L9P)
SYNC_N: U1.AK10(IO_L5N) ; port PCIe_CLK0.Sync_N
SYNC_N: U1.AK8(IO_L7N) ; port PCIe_CLK1.Sync_N  [a separate net that carries the same name]
SYNC_N: U1.AF7(IO_L9N) ; port PCIe_CLK2.Sync_N  [a separate net that carries the same name]
SYNC_N: U1.AK6(IO_L15N) ; port PCIe_CLK3.Sync_N  [a separate net that carries the same name]
SYNC_N: U1.AK4(IO_L17N) ; port PCIe_CLK4.Sync_N  [a separate net that carries the same name]
SYNC_P: U1.AJ10(IO_L5P) ; port PCIe_CLK0.Sync_P
SYNC_P: U1.AK9(IO_L7P) ; port PCIe_CLK1.Sync_P  [a separate net that carries the same name]
SYNC_P: U1.AF8(IO_L9P) ; port PCIe_CLK2.Sync_P  [a separate net that carries the same name]
SYNC_P: U1.AK7(IO_L15P) ; port PCIe_CLK3.Sync_P  [a separate net that carries the same name]
SYNC_P: U1.AJ4(IO_L17P) ; port PCIe_CLK4.Sync_P  [a separate net that carries the same name]
SYNC_WR_R: R904.1 U1.C12(IO_L9N)
uart_FPGA_RxD_R: R909.1 U1.B12(IO_L12P)
uart_FPGA_TxD_R: R910.1 U1.A12(IO_L12N)
US2_FTDI_UART1_RXD: R910.2 ; port uart1.TxD
US2_FTDI_UART1_TXD: R909.2 ; port uart1.RxD
US+_MGTVccAux: R363.1 R364.1 R365.1 U15.1(DIR1) U15.7(DIR3) U15.8(DIR4) U15.16(VCCA) ; port Vcc_HP, port Vcc_HD
WR_LMK_CLK_RC_HF1_N: U1.AJ1(IO_L20N) ; port WR_CLK.N
WR_LMK_CLK_RC_HF1_P: U1.AJ2(IO_L20P) ; port WR_CLK.P
WR_LMK_CLK_RC_HF2_N: U1.C17(IO_L10P) ; port WR_CLK1.P
WR_LMK_CLK_RC_HF2_P: U1.B16(IO_L10N) ; port WR_CLK1.N
NetJ1_PCIE0_20: R507.2 ; port PCIe_CLK_Syncs.PCIeInt1
NetJ1_PCIE1_20: R514.2 ; port PCIe_CLK_Syncs.PCIeInt2
NetJ1_PCIE2_20: R901.2 ; port PCIe_CLK_Syncs.PCIeInt3
NetJ1_PCIE3_20: R902.2 ; port PCIe_CLK_Syncs.PCIeInt4
NetJ1_PCIE4_20: R903.2 ; port PCIe_CLK_Syncs.PCIeInt5
NetR75_1: R75.1 U1.H16(IO_L4N)
NetR507_1: R507.1 U1.H13(IO_L3P)
NetR514_1: R514.1 U1.H12(IO_L3N)
NetR901_1: R901.1 U1.H14(IO_L4P)
NetR902_1: R902.1 U1.G14(IO_L4N)
NetR918_1: R918.1 U1.J14(IO_L3N)
NetR918_2: R918.2 ; port En_I2C0
NetR919_1: R919.1 U1.J16(IO_L4P)
NetR919_2: R919.2 ; port En_I2C1

Not connected (* = marked no-connect by the designer): U1 A15(IO_L12N) AE10(IO_T0U_N12_VRP)* AE12(VREF)* AF1(IO_T3U_N12)* AF2(IO_L24N_/_PERSTN0) AF5(IO_L18N)* AF6(IO_L18P)* AF11(IO_L2N)* AF12(IO_L2P)* AG5(IO_L14N_GC)* AG6(IO_L14P_GC)* AG8(IO_L11P_GC)* AG9(IO_T1U_N12)* AG11(IO_L3P)* AH1(IO_L23N) AH4(IO_T2U_N12)* AH6(IO_L13P_GC)* AH7(IO_L12P_GC)* AH8(IO_L11N_GC)* AH11(IO_L3N)* AH12(IO_L1P)* AJ6(IO_L13N_GC)* AJ7(IO_L12N_GC)* AJ12(IO_L1N)* AK2(IO_L19N)* AK3(IO_L19P)* B15(IO_L12P) C13(IO_L8N_GC)* D14(IO_L8P_GC)* D15(IO_L8N_GC)* D17(IO_L7N_GC)* E12(IO_L6N_GC)* E13(IO_L7N_GC)* E14(IO_L7P_GC)* E15(IO_L8P_GC)* E17(IO_L7P_GC)* F12(IO_L6P_GC)* F13(IO_L5N_GC)* F15(IO_L6N_GC)* F16(IO_L6P_GC)* G13(IO_L5P_GC)* G15(IO_L5N_GC)* G16(IO_L5P_GC)* J15(IO_L3P)* K14(IO_L2N)* K15(IO_L2P)* L14(IO_L1N)* L15(IO_L1P)*

### Layout directives
net class SPI_US2_R: SPI_FPGA_CLK, SPI_FPGA_CS, SPI_FPGA_MISO, SPI_FPGA_MOSI
net class SPI_US2_FPGA_R: SPI_FPGA_CLK_R
net class UART_FPGA_R: uart_FPGA_RxD_R, uart_FPGA_TxD_R

### Notes on the sheet
- HP (64, 65, 66)  1.8V
- Net label SYSREF and SYNC set in PCIe
  Single_50
  Diif_100
- (near U1) Zamieniona polaryzacja
- (near U1) 1V8
- (near U1) HD(45, 46)  1V8
- 1V8
- Title
- Size:
- Date:
- A3
- Number:
- Time:
- Revision:
- Sheet
- of
- File:
- (in symbol FBVB900, part F) Bank 65
- (in symbol FBVB900, part N) Bank 45
- (in symbol FBVB900, part O) Bank 46

### Library data of the parts
R75 R395 R398 R506 R507 R514 R900-R910 R918 R919 = Resistor: as R539 on sheet LTC6952; Supplier 1: Digi-Key; Supplier Part Number 1: 311-0.0JRCT-ND; Stock 1: 69822252; Pricing 1: 1=0.10000, 10=0.01200, 25=0.00920, 50=0.00680, 100=0.00510, 250=0.00388, 500=0.00308, 1000=0.00227, 5000=0.00163 (USD); RoHS: Yes; Case/Package: 0402; Contact Plating: Tin,Matte; Case Code (Metric): 1005; Case Code (Imperial): 0402; Min Operating Temperature: -55°C; Max Operating Temperature: 155°C; Resistance: 0mR; Packaging: Tape and Reel; Composition: Thick Film; Package Quantity: 1; Number of Terminations: 2; Termination: SMD/SMT; Military Standard: Not; Features: Moisture Resistant; Length: 1mm; Height: 0.016inch; Width: 0.02inch; Depth: 0.5mm; Radiation Hardening: No; REACH SVHC: Unknown; Lead Free: Lead Free; ComponentLink1URL: https://datasheet.ciiva.com/2452/pyu-rc0402-51-rohs-l-6-2452608.pdf?src-supplier=Digi-Key; ComponentLink1Description: https://datasheet.ciiva.com/2452/pyu-rc0402-51-rohs-l-6-2452608.pdf?src-supplier=Digi-Key; ComponentLink2URL: https://datasheet.ciiva.com/11808/0900766b80c66297-11808195.pdf?src-supplier=RSComponents; ComponentLink2Description: https://datasheet.ciiva.com/11808/0900766b80c66297-11808195.pdf?src-supplier=RSComponents; ComponentLink3URL: https://datasheet.ciiva.com/2452/pyu-r-int-thick-7-2452609.pdf?src-supplier=Digi-Key; ComponentLink3Description: https://datasheet.ciiva.com/2452/pyu-r-int-thick-7-2452609.pdf?src-supplier=Digi-Key; ComponentLink4URL: https://datasheet.ciiva.com/22747/1018594-22747515.pdf?src-supplier=Element14; ComponentLink4Description: https://datasheet.ciiva.com/22747/1018594-22747515.pdf?src-supplier=Element14; ComponentLink5URL: https://datasheet.ciiva.com/7983/1018594-7983535.pdf?src-supplier=Element14; ComponentLink5Description: https://datasheet.ciiva.com/7983/1018594-7983535.pdf?src-supplier=Element14; ComponentLink6URL: https://datasheet.ciiva.com/2452/pyu-r-int-thick-7-2452610.pdf?src-supplier=Digi-Key; ComponentLink6Description: https://datasheet.ciiva.com/2452/pyu-r-int-thick-7-2452610.pdf?src-supplier=Digi-Key; ComponentLink7URL: https://datasheet.ciiva.com/8896/pyu-rc0402-51-rohs-l-6-8896201.pdf?src-supplier=Avnet; ComponentLink7Description: https://datasheet.ciiva.com/8896/pyu-rc0402-51-rohs-l-6-8896201.pdf?src-supplier=Avnet; ComponentLink8URL: https://datasheet.ciiva.com/28386/pyu-rc0402-51-rohs-l-6-28386633.pdf?src-supplier=Avnet+Europe; ComponentLink8Description: https://datasheet.ciiva.com/28386/pyu-rc0402-51-rohs-l-6-28386633.pdf?src-supplier=Avnet+Europe; ComponentLink9URL: https://datasheet.ciiva.com/15189/getdatasheetpartid-326379-15189533.pdf?src-supplier=Verical; ComponentLink9Description: https://datasheet.ciiva.com/15189/getdatasheetpartid-326379-15189533.pdf?src-supplier=Verical
R124 = Resistor: PANASONIC - ERJ-2RKF1001X - SMD Chip Resistor, 0402 [1005 Metric], 1 kohm, ERJ2R Series, 50 V, Thick Film, 100 mW; Temperature Coefficient: 100ppm/°C; Tolerance: 1%; Voltage Rating (DC): 50V; Power Rating: 100mW; Supplier 1: Digi-Key; Supplier Part Number 1: P1.00KLDKR-ND; Manufacturer: Panasonic; Manufacturer Part Number: ERJ-2RKF1001X; RoHS: Yes; Category: Chip SMD Resistors; Stock 1: 1864188; Pricing 1: 1=0,10000, 10=0,04300, 100=0,01740, 1000=0,00782, 2500=0,00678, 5000=0,00561 (USD); Mount: Surface Mount; Case/Package: 0402; Number of Pins: 2; Contact Plating: Tin; Case Code (Imperial): 0402; Case Code (Metric): 1005; Min Operating Temperature: -55°C; Max Operating Temperature: 155°C; Composition: Thick Film; Resistance: 1kR; Termination: SMD/SMT; Number of Terminations: 2; Military Standard: Not; Features: Automotive AEC-Q200; Packaging: Tape and Reel; Voltage Rating: 50V; Package Quantity: 1; Max Power Dissipation: 100mW; Working Voltage: 50V; Length: 1mm; Height: 0.35mm; Depth: 0.5mm; Width: 0.5mm; Radiation Hardening: No; Lead Free: Lead Free; REACH SVHC: No SVHC; ComponentLink1URL: https://datasheet.ciiva.com/11821/0900766b80f80784-11821203.pdf?src-supplier=RSComponents; ComponentLink1Description: https://datasheet.ciiva.com/11821/0900766b80f80784-11821203.pdf?src-supplier=RSComponents; ComponentLink2URL: https://datasheet.ciiva.com/7942/aoa0000ce2-7942426.pdf?src-supplier=Element14; ComponentLink2Description: https://datasheet.ciiva.com/7942/aoa0000ce2-7942426.pdf?src-supplier=Element14; ComponentLink3URL: https://datasheet.ciiva.com/16523/aoa0000ce2-16523834.pdf?src-supplier=Avnet+Asia; ComponentLink3Description: https://datasheet.ciiva.com/16523/aoa0000ce2-16523834.pdf?src-supplier=Avnet+Asia; ComponentLink4URL: https://datasheet.ciiva.com/17215/aoa0000ce2-17215308.pdf?src-supplier=Avnet+Europe; ComponentLink4Description: https://datasheet.ciiva.com/17215/aoa0000ce2-17215308.pdf?src-supplier=Avnet+Europe; ComponentLink5URL: https://datasheet.ciiva.com/22673/1678782-22673916.pdf?src-supplier=Element14; ComponentLink5Description: https://datasheet.ciiva.com/22673/1678782-22673916.pdf?src-supplier=Element14; ComponentLink6URL: https://datasheet.ciiva.com/28532/1678782-28532109.pdf?src-supplier=Element14; ComponentLink6Description: https://datasheet.ciiva.com/28532/1678782-28532109.pdf?src-supplier=Element14; ComponentLink7URL: https://datasheet.ciiva.com/16767/70260748-16767559.pdf?src-supplier=Allied+Electronics; ComponentLink7Description: https://datasheet.ciiva.com/16767/70260748-16767559.pdf?src-supplier=Allied+Electronics; ComponentLink8URL: https://datasheet.ciiva.com/9198/aoa0000ce2-9198920.pdf?src-supplier=Avnet; ComponentLink8Description: https://datasheet.ciiva.com/9198/aoa0000ce2-9198920.pdf?src-supplier=Avnet; ComponentLink9URL: https://datasheet.ciiva.com/16771/70260748-16771979.pdf?src-supplier=Allied+Electronics; ComponentLink9Description: https://datasheet.ciiva.com/16771/70260748-16771979.pdf?src-supplier=Allied+Electronics
R363-R365 = Resistor: Manufacturer: Panasonic; Manufacturer Part Number: ERJ-2RKF4701X; Tolerance: 1%; Temperature Coefficient: 100ppm/°C; Power Rating: 100mW; Voltage Rating: 50V; Supplier 1: Digi-Key; Supplier Part Number 1: P4.70KLCT-ND; Stock 1: 5361977; Pricing 1: 1 = 0,10000, 10 = 0,05500, 100 = 0,02250, 1000 = 0,01009, 2500 = 0,00876, 5000 = 0,00724 (USD); RoHS: Yes; Mount: Surface Mount; Case/Package: 0402; Number of Pins: 2; Case Code (Imperial): 0402; Case Code (Metric): 1005; Contact Plating: Tin; Min Operating Temperature: -55°C; Max Operating Temperature: 155°C; Resistance: 4.7kR; Packaging: Tape and Reel; Composition: Thick Film; Package Quantity: 1; Termination: SMD/SMT; Voltage Rating (DC): 50V; Number of Terminations: 2; Military Standard: Not; Max Power Dissipation: 100mW; Features: Automotive AEC-Q200; Length: 1mm; Height: 0.35mm; Width: 0.02inch; Depth: 0.5mm; Radiation Hardening: No; Lead Free: Lead Free; REACH SVHC: No SVHC; ComponentLink1URL: https://datasheet.ciiva.com/11821/0900766b80f80784-11821329.pdf?src-supplier=RSComponents; ComponentLink1Description: https://datasheet.ciiva.com/11821/0900766b80f80784-11821329.pdf?src-supplier=RSComponents; ComponentLink2URL: https://datasheet.ciiva.com/30053/aoa0000ce2-30053990.pdf?src-supplier=Onlinecomponents.com; ComponentLink2Description: https://datasheet.ciiva.com/30053/aoa0000ce2-30053990.pdf?src-supplier=Onlinecomponents.com; ComponentLink3URL: https://datasheet.ciiva.com/7830/aoa0000ce2-7830727.pdf?src-supplier=Element14; ComponentLink3Description: https://datasheet.ciiva.com/7830/aoa0000ce2-7830727.pdf?src-supplier=Element14; ComponentLink4URL: https://datasheet.ciiva.com/22781/1678782-22781576.pdf?src-supplier=Farnell; ComponentLink4Description: https://datasheet.ciiva.com/22781/1678782-22781576.pdf?src-supplier=Farnell; ComponentLink5URL: https://datasheet.ciiva.com/9195/aoa0000ce2-9195737.pdf?src-supplier=Avnet; ComponentLink5Description: https://datasheet.ciiva.com/9195/aoa0000ce2-9195737.pdf?src-supplier=Avnet; ComponentLink6URL: https://datasheet.ciiva.com/17213/aoa0000ce2-17213180.pdf?src-supplier=Avnet+Europe; ComponentLink6Description: https://datasheet.ciiva.com/17213/aoa0000ce2-17213180.pdf?src-supplier=Avnet+Europe; ComponentLink7URL: https://datasheet.ciiva.com/22667/1678782-22667886.pdf?src-supplier=Element14; ComponentLink7Description: https://datasheet.ciiva.com/22667/1678782-22667886.pdf?src-supplier=Element14; ComponentLink8URL: https://datasheet.ciiva.com/16763/70260748-16763151.pdf?src-supplier=Allied+Electronics; ComponentLink8Description: https://datasheet.ciiva.com/16763/70260748-16763151.pdf?src-supplier=Allied+Electronics; ComponentLink9URL: https://datasheet.ciiva.com/22723/1678782-22723903.pdf?src-supplier=Element14; ComponentLink9Description: https://datasheet.ciiva.com/22723/1678782-22723903.pdf?src-supplier=Element14; ComponentLink10URL: https://datasheet.ciiva.com/24025/aoa0000ce2-24025663.pdf?src-supplier=Mouser; ComponentLink10Description: https://datasheet.ciiva.com/24025/aoa0000ce2-24025663.pdf?src-supplier=Mouser
U1 = FBVB900: FPGA Zynq UltraScale+ Family 192150 Cells 20nm Technology 0.85V 900-Pin FCBGA Tray; Manufacturer Part Number: XCZU4CG-1FBVB900E; Manufacturer: Xilinx; Peripherals: WDT,DMA; Interface: I2C,SPI,USB,Ethernet,MMC,SDIO,SD,UART,USART,EBI/EMI; Core Architecture: ARM; RAM Size: 256KB; Frequency: 500MHz; Number of I/Os: 204; Supplier 1: Mouser; Supplier Part Number 1: 217-CZU4CG-1FBVB900E; Stock 1: 3; Pricing 1: 1=0,00000, 5=1060,70000 (USD); RoHS: No; Case/Package: FCBGA; Min Operating Temperature: 0°C; Max Operating Temperature: 100°C; Packaging: Tray; ComponentLink1URL: https://www.xilinx.com/support/documentation/data_sheets/ds891-zynq-ultrascale-plus-overview.pdf?src-supplier=Digi-Key; ComponentLink1Description: https://www.xilinx.com/support/documentation/data_sheets/ds891-zynq-ultrascale-plus-overview.pdf?src-supplier=Digi-Key; ComponentLink2URL: https://www.xilinx.com/support/documentation/data_sheets/ds925-zynq-ultrascale-plus.pdf?src-supplier=Digi-Key; ComponentLink2Description: https://www.xilinx.com/support/documentation/data_sheets/ds925-zynq-ultrascale-plus.pdf?src-supplier=Digi-Key; Supplier 2: Avnet; Supplier 3: Digi-Key; Supplier Part Number 2: XCZU4CG-1FBVB900E; Supplier Part Number 3: XCZU4CG-1FBVB900E-ND
U15 = SN74AXC4T774PWR: Manufacturer 1: Texas Instruments; Supplier 1: Digi-Key; Manufacturer Part Number 1: SN74AXC4T774PWR; Stock 1: 2000; Pricing 1: 1=1,14000, 10=1,01500, 100=0,79120, 500=0,65364, 1000=0,51603 (USD); RoHS: No; Supplier Part Number 1: 296-SN74AXC4T774PWRCT-ND